# Altium schematic sheet 4.Communication Interface.SchDoc
size A3; Date: 21/11/16; Author: Daijun; Revision: 2.0; SheetNumber: 4; SheetTotal: 4; Size: A3; Contact: 0731-88731029
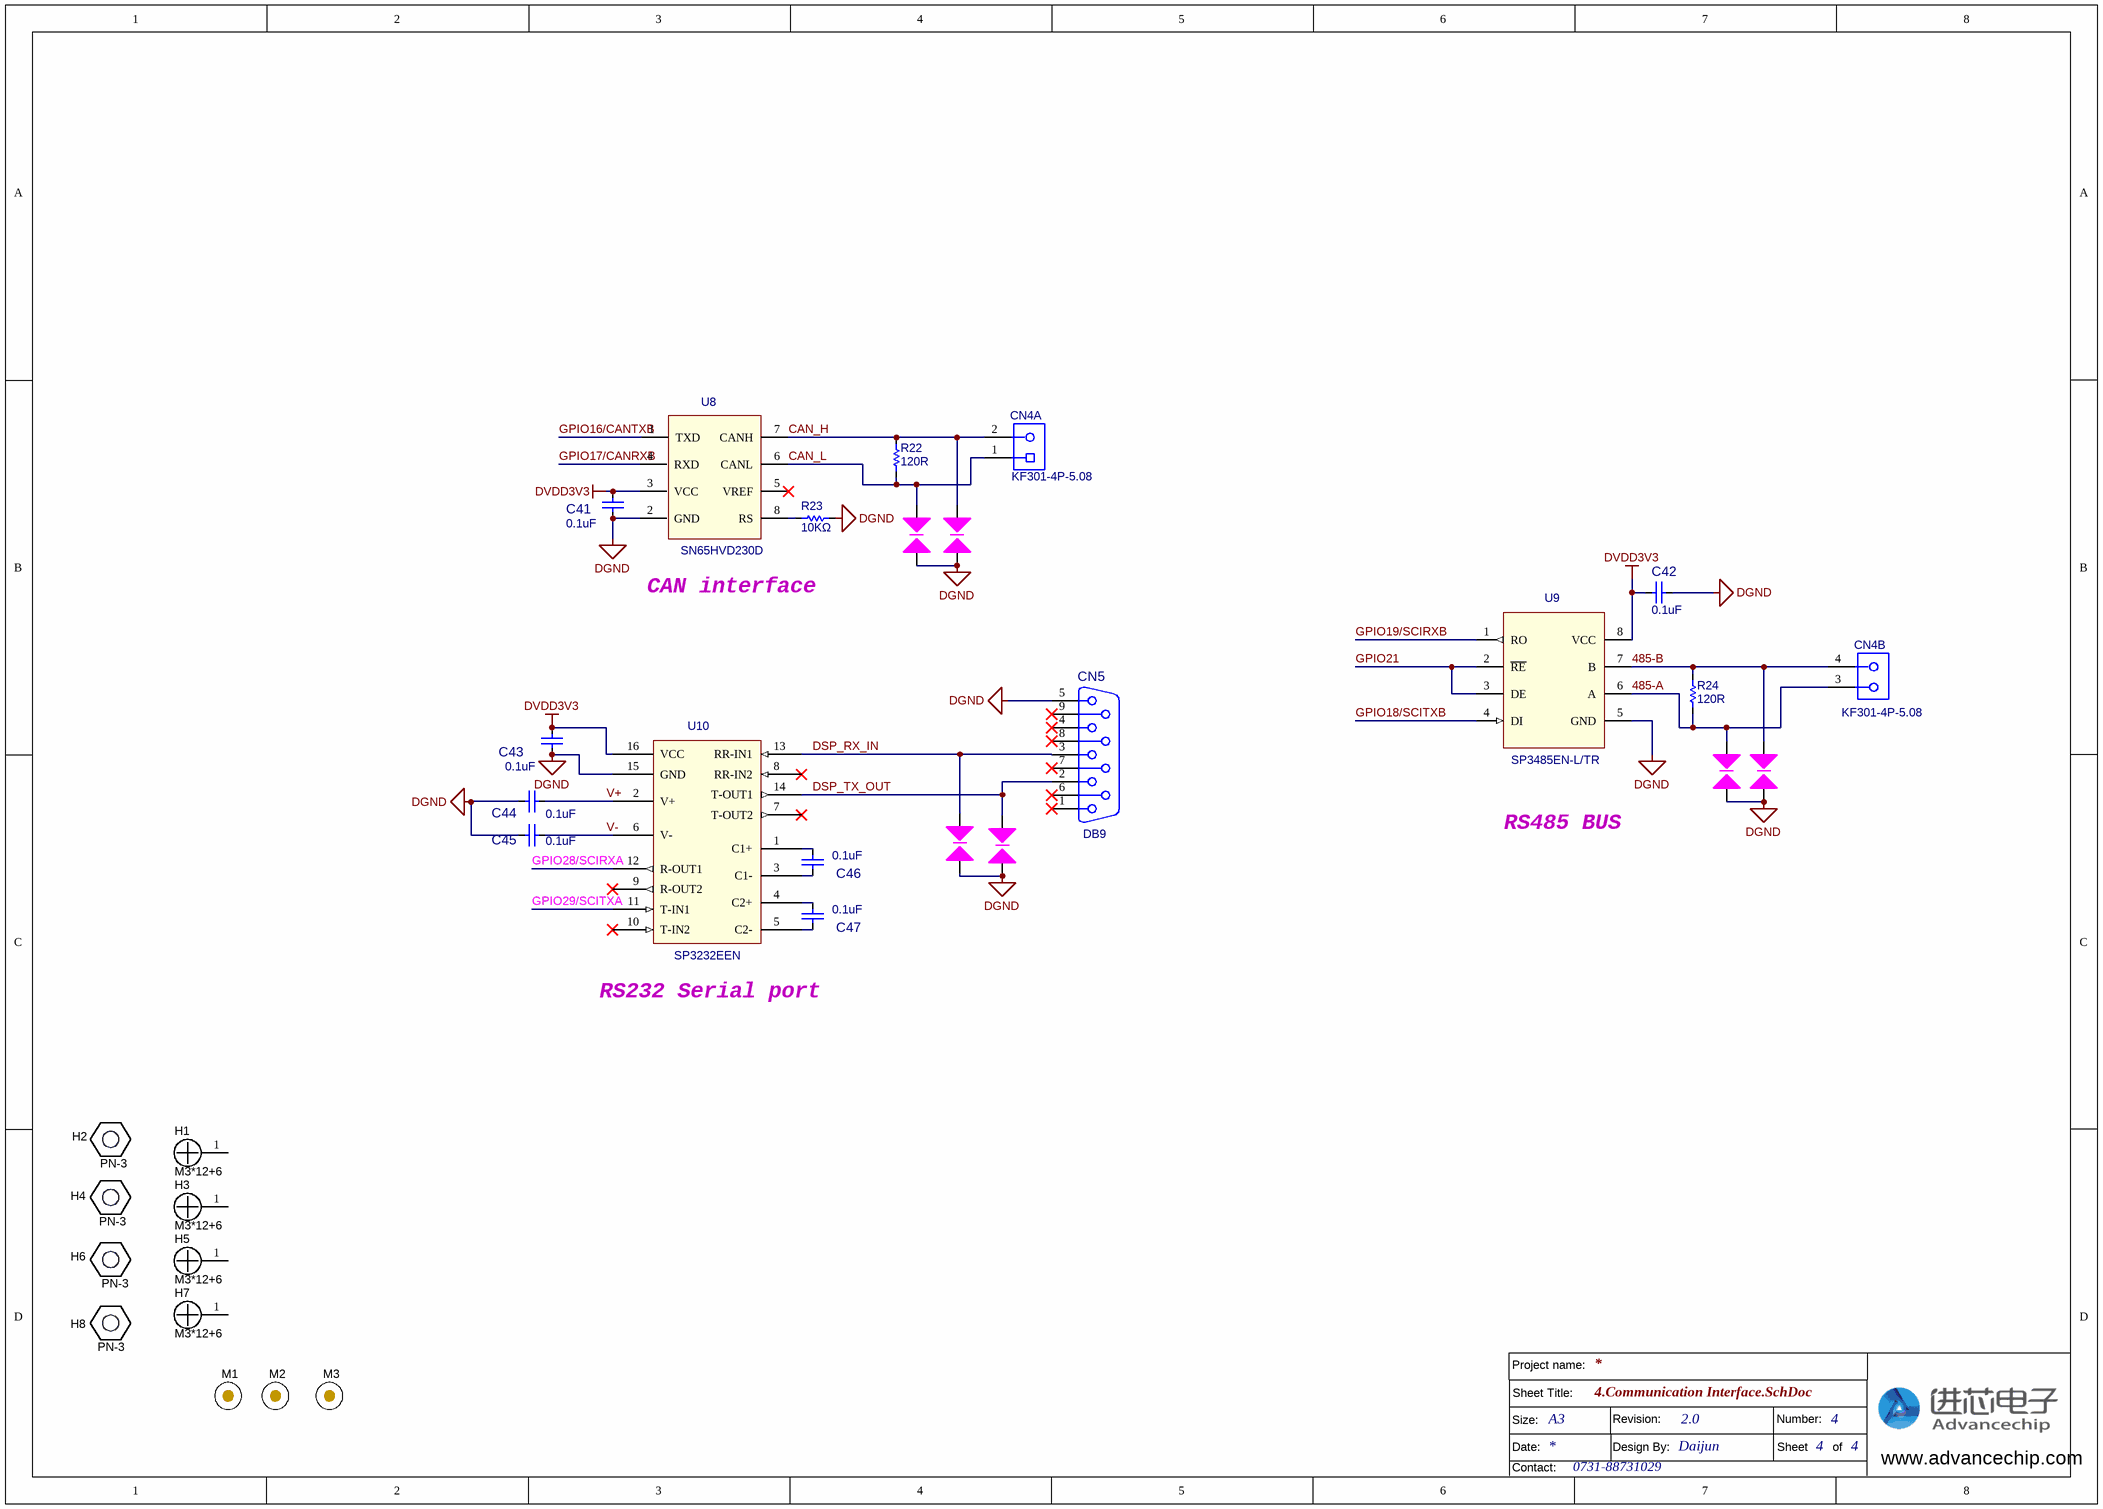
[diagram p0: 4.Communication Interface.SchDoc]

## Parts
C41  value 0.1uF  [0603CX]  (hidden comment: 0.1uF/50V)
C42  value 0.1uF  [0603CX]  (hidden comment: 0.1uF/50V)
C43  value 0.1uF  [0603CX]  (hidden comment: 0.1uF/50V)
C44  value 0.1uF  [0603CX]  (hidden comment: 0.1uF/50V)
C45  value 0.1uF  [0603CX]  (hidden comment: 0.1uF/50V)
C46  value 0.1uF  [0603CX]  (hidden comment: 0.1uF/50V)
C47  value 0.1uF  [0603CX]  (hidden comment: 0.1uF/50V)
CN4  KF301-4P-5.08  [J-DG128-4]  (parts A,B of 2)
CN5  DB9  [db9]
H1  M3*12+6  [NY PMS 440 0025 PH]
H2  PN-3  [Keystone_1902C]
H3  M3*12+6  [NY PMS 440 0025 PH]
H4  PN-3  [Keystone_1902C]
H5  M3*12+6  [NY PMS 440 0025 PH]
H6  PN-3  [Keystone_1902C]
H7  M3*12+6  [NY PMS 440 0025 PH]
H8  PN-3  [Keystone_1902C]
M1  (no value)  [Mark1]
M2  (no value)  [Mark1]
M3  (no value)  [Mark1]
R22  120R  [1206RX]
R23  10KΩ  [0603RX]
R24  120R  [1206RX]
T1  SPARK_GAP  [SPARK_GAP]  (value not drawn)
T2  SPARK_GAP  [SPARK_GAP]  (value not drawn)
T3  SPARK_GAP  [SPARK_GAP]  (value not drawn)
T4  SPARK_GAP  [SPARK_GAP]  (value not drawn)
T5  SPARK_GAP  [SPARK_GAP]  (value not drawn)
T6  SPARK_GAP  [SPARK_GAP]  (value not drawn)
U8  SN65HVD230D  [SO-8]
U9  SP3485EN-L/TR  [SO-8]
U10  SP3232EEN  [SOIC-16_150mil]

## Nets
DGND: C41.2 C42.2 C43.2 C44.2 C45.2 CN5.5 R23.1 T1.2(A) T2.2(A) T3.2(A) T4.2(A) T5.2(A) T6.2(A) U8.2(GND) U9.5(GND) U10.15(GND)
DVDD3V3: C41.1 C42.1 C43.1 U8.3(VCC) U9.8(VCC) U10.16(VCC)
485-A: CN4.3 R24.1 T3.1(A) U9.6(A)
485-B: CN4.4 R24.2 T4.1(A) U9.7(B)
CAN_H: CN4.2 R22.2 T2.1(A) U8.7(CANH)
CAN_L: CN4.1 R22.1 T1.1(A) U8.6(CANL)
DSP_RX_IN: CN5.3 T5.1(A) U10.13(RR-IN1)
DSP_TX_OUT: CN5.2 T6.1(A) U10.14(T-OUT1)
GPIO16/CANTXB: U8.1(TXD)
GPIO17/CANRXB: U8.4(RXD)
GPIO18/SCITXB: U9.4(DI)
GPIO19/SCIRXB: U9.1(RO)
GPIO21: U9.2(~{RE}) U9.3(DE)
GPIO28/SCIRXA: U10.12(R-OUT1)
GPIO29/SCITXA: U10.11(T-IN1)
V+: C44.1 U10.2(V+)
V-: C45.1 U10.6(V-)
NetC46_1: C46.1 U10.1(C1+)
NetC46_2: C46.2 U10.3(C1-)
NetC47_1: C47.1 U10.4(C2+)
NetC47_2: C47.2 U10.5(C2-)
NetR23_2: R23.2 U8.8(RS)

Not connected (* = marked no-connect by the designer): CN5 1* 4* 6* 7* 8* 9*; H1 1; H3 1; H5 1; H7 1; U8 5(VREF)*; U10 7(T-OUT2)* 8(RR-IN2)* 9(R-OUT2)* 10(T-IN2)*

## Notes on the sheet
- CAN interface
- RS485 BUS
- RS232 Serial port
- Sheet Title:
- Project name:
- Size:
- Date:
- Contact:
- Revision:
- Design By:
- Number:
- Sheet       of
- www.advancechip.com

## Library data of the parts
C41-C47 = Cap: 贴片电容; Published: 8-Jun-2000; LatestRevisionDate: 17-Jul-2002; LatestRevisionNote: Re-released for DXP Platform.; Publisher: Altium Limited
CN4 = CON4: 连接器
CN5 = D Connector 9: DB9插座; PackageDocument: O; Positions: 9; Gender: Receptacle; Published: 15-Jun-2001; LatestRevisionDate: 17-Jul-2002; LatestRevisionNote: Re-released for DXP Platform.; DatasheetDocument: 1-Sep-1999; PackageReference: 788750; Publisher: Altium Limited; Orientation: Right Angle
H1 H3 H5 H7 = CMP-0003617-1: 安装孔
H2 H4 H6 H8 = CMP-0003610-1: Standoff, Hex, 0.5"L #4-40 Nylon
M1-M3 = CMP-0077181-1: MARK点
R22 = Res: 贴片电阻; Published: 8-Jun-2000; LatestRevisionDate: 17-Jul-2002; LatestRevisionNote: Re-released for DXP Platform.; Publisher: Altium Limited
R23 R24 = Res: 贴片电阻; Value: 1K; Published: 8-Jun-2000; LatestRevisionDate: 17-Jul-2002; LatestRevisionNote: Re-released for DXP Platform.; Publisher: Altium Limited
T1-T6 = GND SIDE: 静电GAP
U8 = SN65HVD230D: 3.3V CAN通讯
U9 = SP3485E: 3.3V 485总线收发器
U10 = MAX232: 低压232通讯芯片